# Altium schematic sheet UHF.SchDoc
size A3; SheetNumber: 8; SheetTotal: 11
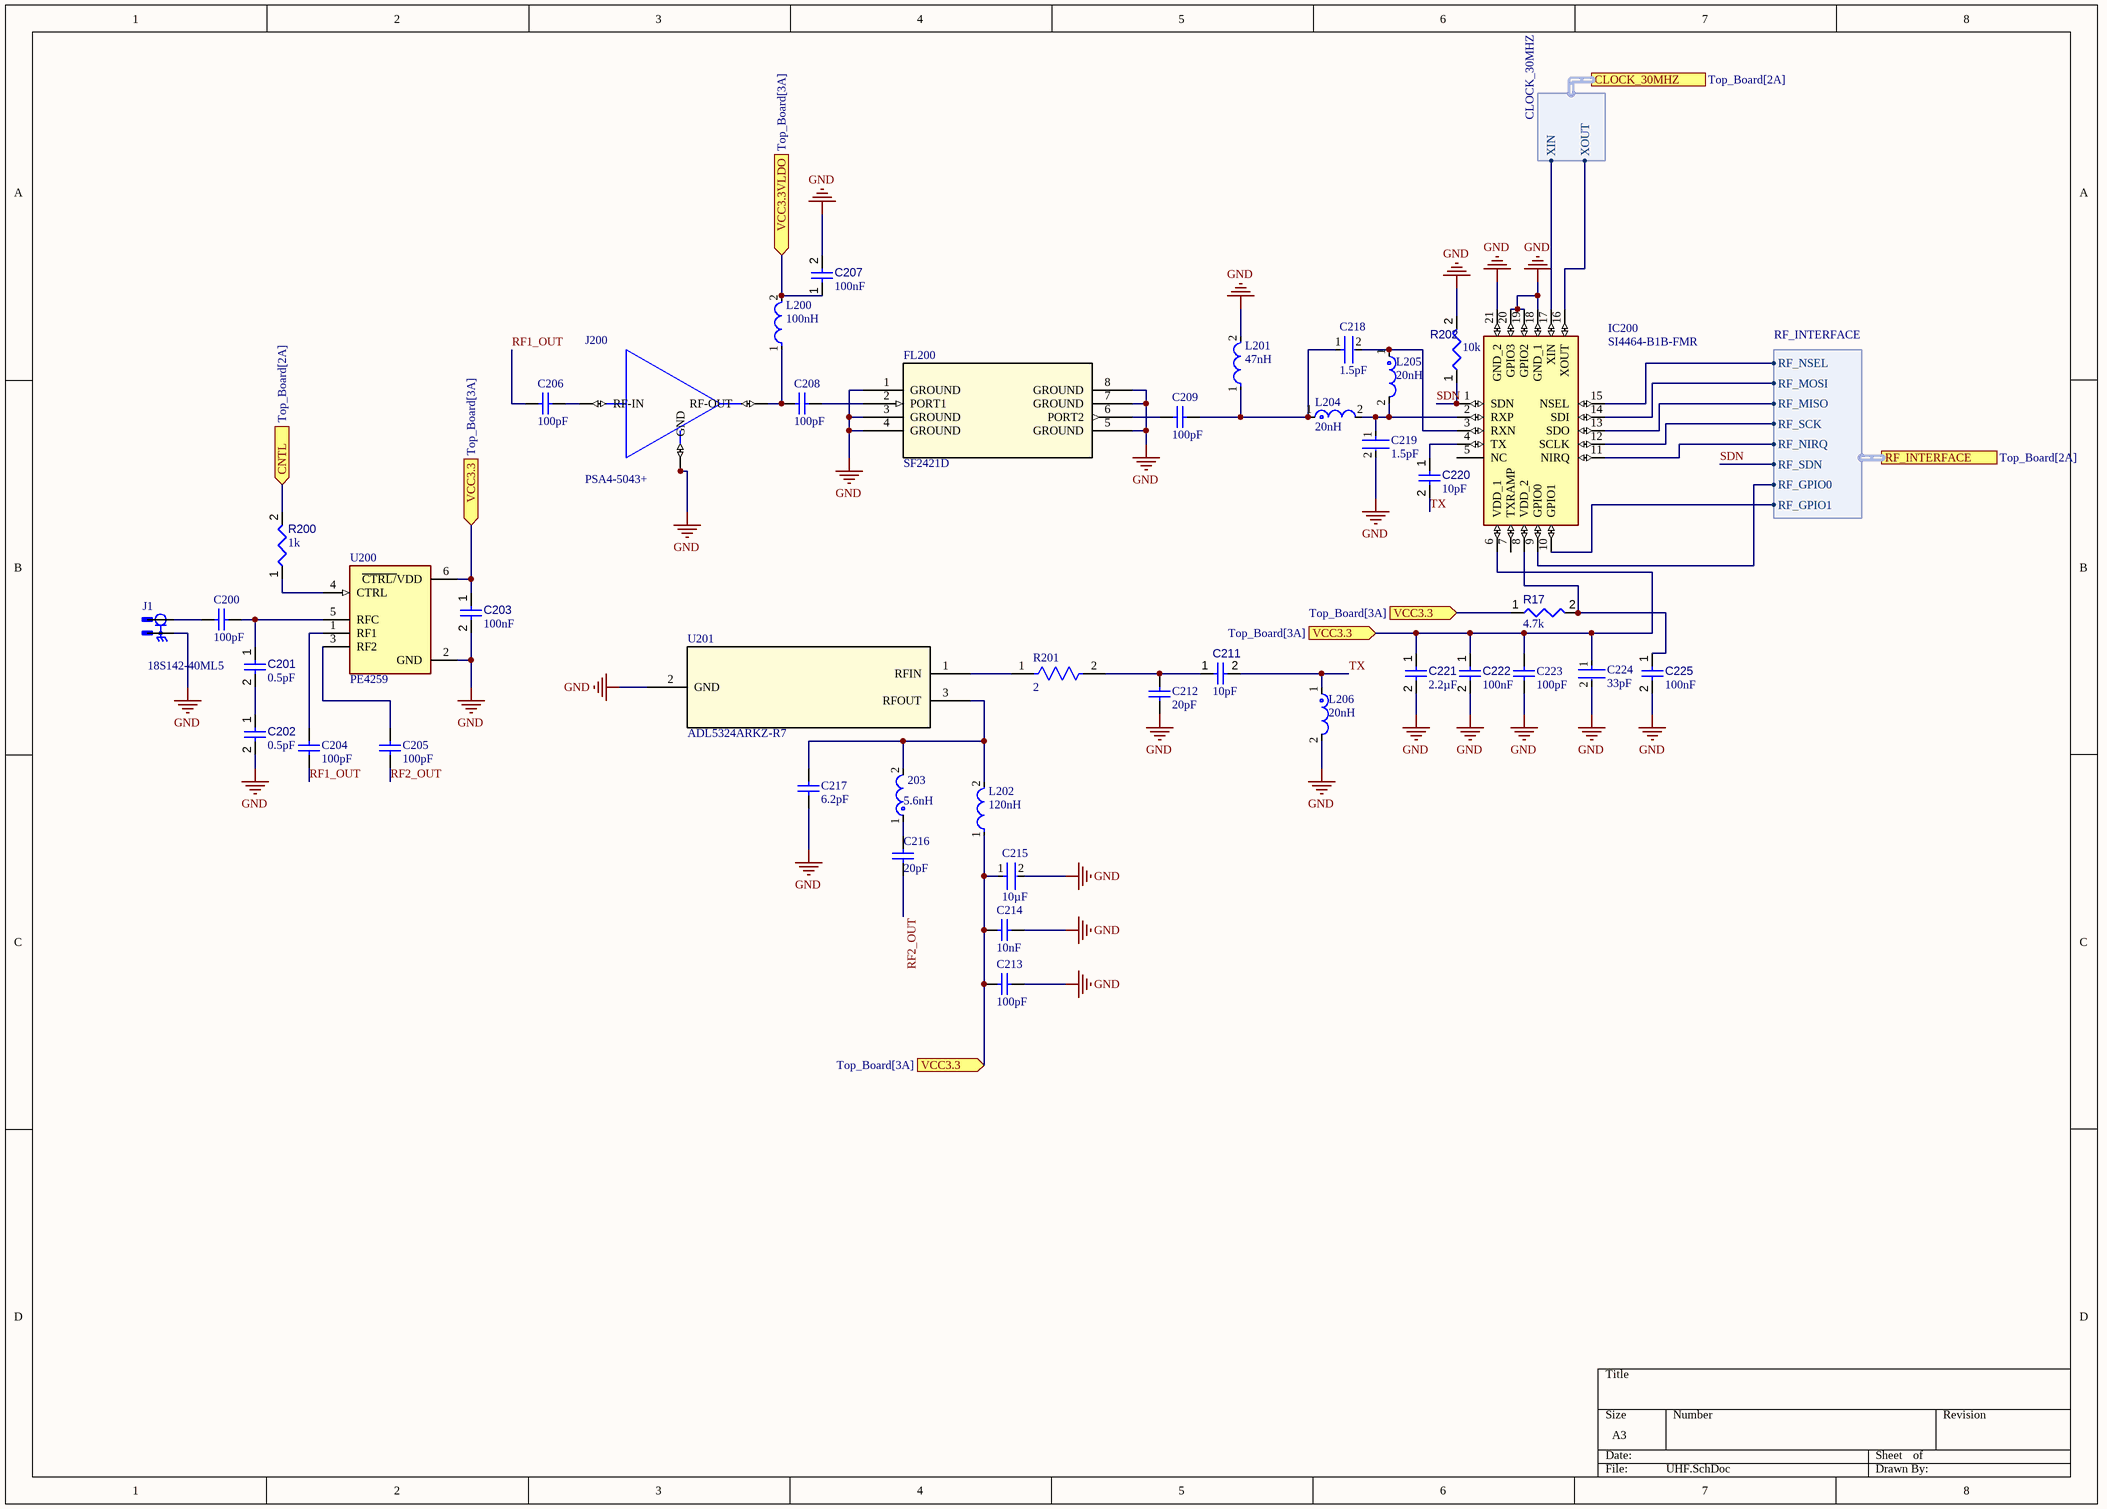
[diagram p0: UHF.SchDoc]

## Parts
203  value 5.6nH  [FP-LQP03TG_02-IPC_C]  (hidden comment: ind 5.6nH 0603)
C200  value 100pF  [CAPC1005X60X26ML10T16]  (hidden comment: cap 100p)
C201  value 0.5pF  [CAPC1005X56X25ML10T15]  (hidden comment: Capacitor 0.5 pF +/- 0.1pF 25 V 0402)
C202  value 0.5pF  [CAPC1005X56X25ML10T15]  (hidden comment: Capacitor 0.5 pF +/- 0.1pF 25 V 0402)
C203  value 100nF  [CAPC0402(1005)60_L]  (hidden comment: Capacitor 100nF +/-20% 50V 0402)
C204  value 100pF  [CAPC1005X60X26ML10T16]  (hidden comment: cap 100p)
C205  value 100pF  [CAPC1005X60X26ML10T16]  (hidden comment: cap 100p)
C206  value 100pF  [CAPC1005X60X26ML10T16]  (hidden comment: cap 100p)
C207  value 100nF  [CAPC2013X95X50LL10T25]  (hidden comment: Capacitor 100 nF +/-10% 50 V 0805)
C208  value 100pF  [CAPC1005X60X26ML10T16]  (hidden comment: cap 100p)
C209  value 100pF  [CAPC1005X60X26ML10T16]  (hidden comment: cap 100p)
C211  value 10pF  [CAPC1608X90X40ML10T20]  (hidden comment: Capacitor 10 pF +/- 5% 50 V 0603)
C212  value 20pF  [CAPC1608X90X35LL15T15]  (hidden comment: cap 20p 0603)
C213  value 100pF  [CAPC1608X92X38LL15T08]  (hidden comment: cap 100pF 0603)
C214  value 10nF  [CAPC1608X92X38LL15T08]  (hidden comment: cap 10nF 0603)
C215  value 10µF  [FP-CC0603-DC-IPC_B]  (hidden comment: cap 10uF 0603)
C216  value 20pF  [CAPC1608X90X35LL15T15]  (hidden comment: cap 20p 0603)
C217  value 6.2pF  [CAPC1608X90X35LL15T15]  (hidden comment: cap 6.2pF 0603)
C218  value 1.5pF  [FP-GJM155-0_05-IPC_A]  (hidden comment: cap 1.5pF)
C219  value 1.5pF  [FP-GJM155-0_05-IPC_A]  (hidden comment: cap 1.5pF)
C220  value 10pF  [CAPC1608X90X40ML10T20]  (hidden comment: Capacitor 10 pF +/- 5% 50 V 0603)
C221  value 2.2µF  [CAPC0402(1005)60_L]  (hidden comment: Capacitor 2,2µF +/-20% 10V 0402)
C222  value 100nF  [CAPC1608X90X40NL10T20]  (hidden comment: Capacitor 100 nF +/-10% 50 V 0603)
C223  value 100pF  [CAPC1608X92X38LL15T08]  (hidden comment: cap 100pF 0603)
C224  value 33pF  [FP-C0603C-CF-IPC_B]  (hidden comment: cap 33pF 0603)
C225  value 100nF  [CAPC1608X90X40NL10T20]  (hidden comment: Capacitor 100 nF +/-10% 50 V 0603)
FL200  SF2421D  [SM3838-8_RFI]
IC200  SI4464-B1B-FMR  [QFN50P400X400X90-21N]
J1  18S142-40ML5  [ROSENBERGER_18S142-40ML5]
J200  PSA4-5043+  [PSA4-5043+]
L200  value 100nH  [FP-0402HPH-MFG]  (hidden comment: ind 100nH)
L201  value 47nH  [FP-MLK1005-MFG]  (hidden comment: ind 47nH)
L202  value 120nH  [FP-AISC-1008-MFG]  (hidden comment: ind 120nH)
L204  value 20nH  [FP-LQG15WH_02-MFG]  (hidden comment: ind 20nH 0402)
L205  value 20nH  [FP-LQG15WH_02-MFG]  (hidden comment: ind 20nH 0402)
L206  value 20nH  [FP-LQG15WH_02-MFG]  (hidden comment: ind 20nH 0402)
R17  value 4.7k  [RESC1608X55X25ML10T15]  (hidden comment: Resistor 4k7 +/-1% 0603 100 mW)
R200  value 1k  [RESC0805(2012)_L]  (hidden comment: Resistor 1K +/-5% 0805 125 mW)
R201  value 2  [FP-RMCF0603-MFG]  (hidden comment: res 2ohms 0603)
R202  value 10k  [RESC2013X50X35ML15T15]  (hidden comment: Resistor 10k +/-1% 0805 125 mW)
U200  PE4259  [SOT65P215X110-6N]
U201  ADL5324ARKZ-R7  [RK_3_ADI]

## Ports
CLOCK_30MHZ (harness CLOCK_30MHZ, see Top_Board[2A]), CNTL (in, see Top_Board[2A]), RF_INTERFACE (harness RF_INTERFACE, see Top_Board[2A]), VCC3.3 (in, see Top_Board[3A]), VCC3.3VLDO (in, see Top_Board[3A])

## Harnesses
CLOCK_30MHZ: XIN, XOUT
RF_INTERFACE: RF_NSEL, RF_MOSI, RF_GPIO1, RF_GPIO0, RF_SDN, RF_NIRQ, RF_SCK, RF_MISO

## Nets
GND: C202.2 C203.2 C207.2 C212.2 C213.2 C214.2 C215.2 C217.2 C219.2 C221.2 C222.2 C223.2 C224.2 C225.2 FL200.1(GROUND) FL200.3(GROUND) FL200.4(GROUND) FL200.5(GROUND) FL200.7(GROUND) FL200.8(GROUND) IC200.18(GND_1) IC200.19(GPIO2) IC200.20(GPIO3) IC200.21(GND_2) J1.G1 J200.2(GND) J200.4(GND) L201.2 L206.2 R202.2 U200.2(GND) U201.2(GND)
CNTL: R200.2 ; port CNTL
RF1_OUT: C204.2 C206.1
RF2_OUT: C205.2 C216.2
SDN: IC200.1(SDN) R202.1 ; port RF_INTERFACE.RF_SDN
TX: C211.2 C220.2 L206.1
VCC3.3: C203.1 C213.1 C214.1 C215.1 C221.1 C222.1 C223.1 C224.1 IC200.6(VDD_1) L202.1 R17.1 U200.6(~{CTRL/}VDD) ; port VCC3.3
VCC3.3VLDO: C207.1 L200.2 ; port VCC3.3VLDO
Net203_1: 203.1 C216.1
Net203_2: 203.2 C217.1 L202.2 U201.3(RFOUT)
NetC200_1: C200.1 J1.1
NetC200_2: C200.2 C201.1 U200.5(RFC)
NetC201_2: C201.2 C202.1
NetC204_1: C204.1 U200.1(RF1)
NetC205_1: C205.1 U200.3(RF2)
NetC206_2: C206.2 J200.3(RF-IN)
NetC208_1: C208.1 J200.1(RF-OUT) L200.1
NetC208_2: C208.2 FL200.2(PORT1)
NetC209_1: C209.1 FL200.6(PORT2)
NetC209_2: C209.2 C218.1 L201.1 L204.1
NetC211_1: C211.1 C212.1 R201.2
NetC218_2: C218.2 IC200.3(RXN) L205.1
NetC219_1: C219.1 IC200.2(RXP) L204.2 L205.2
NetC220_1: C220.1 IC200.4(TX)
NetC225_1: C225.1 IC200.8(VDD_2) R17.2
NetIC200_9: IC200.9(GPIO0) ; port RF_INTERFACE.RF_GPIO0
NetIC200_10: IC200.10(GPIO1) ; port RF_INTERFACE.RF_GPIO1
NetIC200_11: IC200.11(NIRQ) ; port RF_INTERFACE.RF_NIRQ
NetIC200_12: IC200.12(SCLK) ; port RF_INTERFACE.RF_SCK
NetIC200_13: IC200.13(SDO) ; port RF_INTERFACE.RF_MISO
NetIC200_14: IC200.14(SDI) ; port RF_INTERFACE.RF_MOSI
NetIC200_15: IC200.15(NSEL) ; port RF_INTERFACE.RF_NSEL
NetIC200_16: IC200.16(XOUT) ; port CLOCK_30MHZ.XOUT
NetIC200_17: IC200.17(XIN) ; port CLOCK_30MHZ.XIN
NetR200_1: R200.1 U200.4(CTRL)
NetR201_1: R201.1 U201.1(RFIN)

Not connected (* = marked no-connect by the designer): IC200 5(NC) 7(TXRAMP)

## Library data of the parts
203 = CMP-006-00034-1: General Purpose Inductor, 0.0056uH, 5%, 1 Element, Film-Core, Reflow soldering, 0603/0201; Self Resonant Frequency: 4GHz; Current Rating: 350mA; Max Operating Temperature: 125°C; Min Operating Temperature: -55°C; Tolerance: 5%; Max Current Rating: 350mA; Case/Package: 0201
C200 C204-C206 C208 C209 = CMP-001-00096-1: Ceramic Capacitor, Multilayer, Ceramic, 50V, 1% +Tol, 1% -Tol, C0G, 30ppm/Cel TC, 0.0001uF, Surface Mount, 0402; Packaging: Tape and Reel; Height: 600µm; Min Operating Temperature: -55°C; Max Operating Temperature: 150°C; China RoHS: Compliant; Width: 500µm; Case/Package: 0402; Depth: 500µm; REACH SVHC: Unaffected; Lifecycle Status: Production; Voltage Rating (DC): 50V; Mounting Technology: Surface Mount; Tolerance: 1%; Dielectric: C0G; Dielectric Material: Ceramic; Number of Terminals: 2; Length: 1mm; RoHS: Compliant
C201 C202 = CMP-001-00002-6: Chip Capacitor, 0.5 pF, +/- 0.1pF, 25 V, 0402 (1005 Metric); Voltage Rating: 25V; Tolerance: 20%; Capacitor Type: Ceramic; Max Operating Temperature: 125°C; Case/Package: 0402; Pins: 2; RoHS Compliant: True; Min Operating Temperature: -55°C; Mounting Technology: SM
C203 = CMP-001-00067-3: Chip Capacitor, 100nF +/-20%, 50V, 0402, Thickness 0.6 mm; Tolerance: 10%; Min Operating Temperature: -55°C; Pins: 2; Case/Package: 0402; Max Operating Temperature: 85°C; Voltage Rating: 50V; Mounting Technology: SMT
C207 = CMP-001-00018-6: Chip Capacitor, 100 nF, +/- 10%, 50 V, 0805 (2012 Metric); Capacitor Type: Ceramic; Voltage Rating: 50V; Pins: 2; Max Operating Temperature: 125°C; Min Operating Temperature: -55°C; Mounting Technology: SM; Case/Package: 0805; RoHS Compliant: True; Tolerance: 10%
C211 C220 = CMP-001-00014-6: Chip Capacitor, 10 pF, +/- 5%, 50 V, 0603 (1608 Metric); Capacitor Type: Ceramic; Voltage Rating: 50V; RoHS Compliant: True; Case/Package: 0603; Max Operating Temperature: 125°C; Pins: 2; Tolerance: 5%; Mounting Technology: SM; Min Operating Temperature: -55°C
C212 C216 = CMP-001-00097-1: 0603 20 pF 50 V ±10 % Tolerance C0G/NP0 SMT Multilayer Ceramic Capacitor; Tolerance: 10%; Voltage Rating: 50V; Pins: 2; Min Operating Temperature: -55°C; Max Operating Temperature: 125°C; Mounting Technology: Surface Mount; Case/Package: 0603
C213 C223 = CMP-001-00098-1: Ceramic Capacitor, Multilayer, Ceramic, 100V, 10% +Tol, 10% -Tol, C0G, 30ppm/Cel TC, 0.0001uF, Surface Mount, 0603; RoHS: Compliant; China RoHS: Compliant; Case/Package: 0603; Mounting Technology: Surface Mount; Max Operating Temperature: 150°C; Dielectric Material: Ceramic; Number of Terminals: 2; Export Control Classification Number (ECCN) Code: EAR99; Country of Origin: Israel; Harmonized Tariff Schedule (HTS) Code: 8532.24.00.20; Min Operating Temperature: -55°C; Case Code (Metric): 1608; Tolerance: 10%; Termination: SMD/SMT; Lifecycle Status: Production; Voltage Rating (DC): 100V; Depth: 800µm; Length: 1.6mm; Width: 800µm; Dielectric: C0G; Height: 970µm; Case Code (Imperial): 0603; Introduction Date: 1999-11-09; REACH SVHC: Unaffected
C214 = CMP-001-00099-1: Ceramic Capacitor, Multilayer, Ceramic, 50V, 10% +Tol, 10% -Tol, X7R, 15% TC, 0.01uF, Surface Mount, 0603; Lifecycle Status: Production; REACH SVHC: Unaffected; Depth: 800µm; Dielectric: X7R; China RoHS: Non-Compliant; Width: 800µm; Min Operating Temperature: -55°C; RoHS: Compliant; Max Operating Temperature: 150°C; Voltage Rating (DC): 50V; Length: 1.6mm; Height: 970µm; Tolerance: 10%; Case/Package: 0603; Mounting Technology: Surface Mount; Number of Terminals: 2; Dielectric Material: Ceramic
C215 = CMP-001-00100-1: 16V 10uF X5R ±10% 0603 Multilayer Ceramic Capacitors MLCC - SMD/SMT ROHS; Dielectric Material: Ceramic; Number of Terminals: 2; RoHS: Compliant; Export Control Classification Number (ECCN) Code: EAR99; REACH SVHC: Unaffected; Height: 800µm; Introduction Date: 2014-07-08; Mounting Technology: Surface Mount; Tolerance: 10%; Length: 1.6mm; Country of Origin: Mainland China, Taiwan; Halogen Free: Halogen Free; Voltage Rating: 16V; Harmonized Tariff Schedule (HTS) Code: 8532.24.00.20; China RoHS: Compliant; Min Operating Temperature: -55°C; Lifecycle Status: Production; Lead Free: Lead Free; Material: Ceramic; Dielectric: X5R; Max Operating Temperature: 85°C; Voltage Rating (DC): 16V; Case/Package: 0603; Width: 800µm
C217 = CMP-001-00101-1: 50V 6.2pF C0G 0603 Multilayer Ceramic Capacitors MLCC - SMD/SMT ROHS; Export Control Classification Number (ECCN) Code: EAR99; Termination: SMD/SMT; Length: 1.6mm; Number of Terminals: 2; Dielectric Material: Ceramic; Lifecycle Status: Production; Voltage Rating (DC): 50V; Weight: 2.012816mg; Case Code (Imperial): 0603; Dielectric: C0G; Width: 812.8µm; Lead Free: Lead Free; RoHS: Compliant; Thickness: 889µm; Mounting Technology: Surface Mount; Introduction Date: 2013-04-23; Max Operating Temperature: 125°C; China RoHS: Compliant; Radiation Hardening: No; Depth: 810µm; Harmonized Tariff Schedule (HTS) Code: 8532.24.00.20; Voltage Rating: 50V; Case Code (Metric): 1608; Case/Package: 0603; REACH SVHC: Unaffected; Min Operating Temperature: -55°C
C218 C219 = CMP-001-00102-1: Ceramic Capacitor, Multilayer, Ceramic, 50V, 16.67% +Tol, 16.67% -Tol, CH, 60ppm/Cel TC, 0.0000015uF, Surface Mount,...; Manufacturer Lifecycle Status: IN PRODUCTION; Temperature Coefficient: 60ppm/°C; Lifecycle Status: Production; Number of Terminals: 2; RoHS: Compliant; Voltage Rating (DC): 50V; Case/Package: 0402; REACH SVHC: Unaffected; Mounting Technology: Surface Mount; Length: 1mm; Voltage Rating: 50V; Height: 500µm; Thickness: 500µm; Min Operating Temperature: -55°C; Width: 500µm; Material: Ceramic; Dielectric Material: Ceramic; Max Operating Temperature: 125°C
C221 = CMP-001-00056-4: Chip Capacitor, 2,2µF +/-20%, 10V, 0402, Thickness 0.6 mm; Tolerance: 10%; Mounting Technology: SMT; Max Operating Temperature: 85°C; Case/Package: 0402; Pins: 2; Min Operating Temperature: -55°C; Voltage Rating: 10V
C222 C225 = CMP-001-00017-6: Chip Capacitor, 100 nF, +/- 10%, 50 V, 0603 (1608 Metric); Voltage Rating: 50V; Capacitor Type: Ceramic; Tolerance: 10%; Mounting Technology: SM; Max Operating Temperature: 125°C; RoHS Compliant: True; Pins: 2; Case/Package: 0603; Min Operating Temperature: -55°C
C224 = CMP-001-00103-1: Ceramic Capacitor, Multilayer, Ceramic, 50V, 20% +Tol, 20% -Tol, X8R, 15% TC, 3.3e-05uF, Surface Mount, 0603; Temperature Coefficient: 30ppm/°C; Min Operating Temperature: -55°C; Dielectric Material: Ceramic; RoHS: Compliant; Mounting Technology: Surface Mount; Lifecycle Status: Production; Lead Free: Lead Free; Number of Terminals: 2; China RoHS: Compliant; Width: 800µm; Length: 1.6mm; Country of Origin: Mexico; Voltage Rating: 50V; REACH SVHC: Unaffected; Material: Ceramic; Harmonized Tariff Schedule (HTS) Code: 8532.24.00.20; Introduction Date: 2017-10-02; Export Control Classification Number (ECCN) Code: EAR99; Max Operating Temperature: 150°C; Case/Package: 0603; Voltage Rating (DC): 50V; Height: 800µm; Dielectric: X8R
FL200 = CMP-040-000000-1: No Description Available; Manufacturer_Name: RFMi; Source: SF2421D.SchLib; RefDes: RefDes; Copyright: Copyright (C) 2026 Ultra Librarian. All rights reserved.; Type: SAW Filters; Design Item ID: SF2421D; Manufacturer_Part_Number: SF2421D; Component Type: Filters
IC200 = CMP-031-00007-1: IC RF TxRx + MCU General ISM < 1GHz - 119MHz ~ 1.05GHz 20-VFQFN Exposed Pad; MF: Silicon Labs; Component Type: Standard; Pins: 21; Check_prices: https://www.snapeda.com/parts/SI4464-B1B-FMR/Silicon+Labs/view-part/?ref=eda; Case/Package: QFN-20 Silicon Labs; SnapEDA_Link: https://www.snapeda.com/parts/SI4464-B1B-FMR/Silicon+Labs/view-part/?ref=snap; Design Item ID: SI4464-B1B-FMR; Source: SI4464-B1B-FMR.SchLib; MP: SI4464-B1B-FMR; Value: *; Component Type: Integrated Circuits
J1 = CMP-002-00075-1: SMP, Mini Connector Plug, Male Pin 50 Ohms Surface Mount Solder; MF: Rosenberger; Case/Package: None; Source: 18S142-40ML5.SchLib; Design Item ID: 18S142-40ML5; MP: 18S142-40ML5; Check_prices: https://www.snapeda.com/parts/18S142-40ML5/Rosenberger/view-part/?ref=eda; Pins: 2; Component Type: Standard; SnapEDA_Link: https://www.snapeda.com/parts/18S142-40ML5/Rosenberger/view-part/?ref=snap; Value: *; Component Type: Connectors
J200 = CMP-014-00003-1: RF Amplifier IC Cellular, GSM, GPS, ISM, LTE, WCDMA, WiMAX, WLAN 50MHz ~ 4GHz MMM1362; MF: Mini-Circuits; Component Type: Standard; Design Item ID: PSA4-5043+; Pins: 4; Case/Package: None; SnapEDA_Link: https://www.snapeda.com/parts/PSA4-5043+/Mini-Circuits/view-part/?ref=snap; Source: PSA4-5043+.SchLib; Check_prices: https://www.snapeda.com/parts/PSA4-5043+/Mini-Circuits/view-part/?ref=eda; Value: *; MP: PSA4-5043+; Component Type: Amplifiers
L200 = CMP-006-00024-1: General Purpose Inductor, 0.1uH, 5%, 1 Element, Ceramic-Core, SMD, 0402; ESR: 1.2Ω; Test Frequency: 250MHz; Current Rating: 310mA; Number of Circuits: 1; Self Resonant Frequency: 1.58GHz; Shielding: Unshielded; Lead Free: Contains Lead; Export Control Classification Number (ECCN) Code: EAR99; Height: 660µm; Inductance Tolerance: 5%; Country of Origin: Mainland China, Vietnam; LTD Date: 2021-03-01; LTB Date: 2021-03-01; Width: 660µm; Termination: SMD/SMT; DC Resistance (DCR): 1.2Ω; Lifecycle Status: Obsolete; Case Code (Imperial): 0402; Composition: Wirewound; Tolerance: 5%; Case/Package: 0402; Max Current Rating: 310mA; Core Material: Ceramic; Mounting Technology: Surface Mount; Harmonized Tariff Schedule (HTS) Code: 8504.50.80.00; RMS Current (Irms): 310mA; Case Code (Metric): 1005; Packaging: Cut Tape; Max Operating Temperature: 125°C; Min Operating Temperature: -40°C; Number of Terminals: 2; REACH SVHC: Unaffected; China RoHS: Non-Compliant; RoHS: Compliant; Introduction Date: 2009-03-31; Ambient Temperature Range High: 125°C; Length: 1.12mm; Max DC Current: 310mA
L201 = CMP-006-00029-1: Ind RF Chip Unshielded Multi-Layer 47nH 5% 100MHz 6Q-Factor 200mA 0402 Punched Paper T/R; Manufacturer Lifecycle Status: OBSOLETE; ESR: 1.2Ω; Core Material: Ceramic, Ferrite; Number of Circuits: 1; Self Resonant Frequency: 1.8GHz; Q Factor: 6; Number of Terminals: 2; China RoHS: Compliant; REACH SVHC: Unaffected; Schedule B: 8504500000, 8504500000; Max DC Current: 200mA; RMS Current (Irms): 200mA; Radiation Hardening: No; Width: 500µm; DC Resistance (DCR): 1.2Ω; Height - Seated (Max): 609.6µm; Lifecycle Status: Obsolete; Height: 500µm; Harmonized Tariff Schedule (HTS) Code: 8504.50.80.00; Depth: 600µm; Shielding: Unshielded; Max Operating Temperature: 125°C; Test Frequency: 100MHz; Case Code (Metric): 1005; Export Control Classification Number (ECCN) Code: EAR99; Tolerance: 5%; Min Operating Temperature: -55°C; RoHS: Compliant; Packaging: Cut Tape (CT); Min Width: 400µm; Case Code (Imperial): 0402; LTD Date: 2026-06-30; Current Rating: 200mA; Max Length: 1.1mm; Length: 1mm; Mounting Technology: Surface Mount; Min Length: 900µm; Max Width: 600µm; Max Current Rating: 200mA; Case/Package: 0402; LTB Date: 2026-03-31; Introduction Date: 2009-03-27
L202 = CMP-006-00030-1: Ind Chip Wirewound 120nH 5% 25MHz 60Q-Factor Ceramic 650mA 1008 T/R; ESR: 630mΩ; Q Factor: 60; Number of Circuits: 1; Self Resonant Frequency: 950MHz; Shielding: Unshielded; China RoHS: Compliant; Number of Terminals: 2; Lifecycle Status: Production; Termination: SMD/SMT; Max Operating Temperature: 125°C; Depth: 2.79mm; Tolerance: 5%; Test Frequency: 25MHz; Width: 2.79mm; DC Resistance (DCR): 630mΩ; Min Operating Temperature: -40°C; Length: 2.92mm; Height - Seated (Max): 2.286mm; Height: 2.29mm; Case/Package: 1111; Radiation Hardening: No; Mounting Technology: Surface Mount; Case Code (Imperial): 1008; Max DC Current: 650mA; Case Code (Metric): 2520; REACH SVHC: Unaffected; RMS Current (Irms): 650mA; Composition: Wirewound; Core Material: Ceramic; RoHS: Compliant; Current Rating: 650mA; Max Current Rating: 650mA
L204-L206 = CMP-006-00022-1: General Purpose Inductor, 0.02uH, 3%, 1 Element, Reflow soldering, 1005/0402; Manufacturer Lifecycle Status: IN PRODUCTION; Shielding: Unshielded; Test Frequency: 250MHz; Max Current Rating: 260mA; ESR: 1.1Ω; Self Resonant Frequency: 2.1GHz; Q Factor: 20; Core Material: Air; Number of Circuits: 1; Width: 600µm; Max Operating Temperature: 125°C; Export Control Classification Number (ECCN) Code: EAR99; REACH SVHC: Unaffected; Tolerance: 3%; Number of Terminals: 2; Lifecycle Status: Production; Length: 1mm; Harmonized Tariff Schedule (HTS) Code: 8504.50.80.00; Case/Package: 0402; DC Resistance (DCR): 1.1Ω; RMS Current (Irms): 260mA; Height: 500µm; Country of Origin: Japan; Ratings: AEC-Q200; Current Rating: 260mA; Min Operating Temperature: -55°C; RoHS: Compliant; Introduction Date: 2018-02-22
R17 = CMP-009-00031-5: Chip Resistor, 4.7 KOhm, +/- 1%, 0.1 W, -55 to 155 degC, 0603 (1608 Metric); Power: 100mW; Tolerance: 1%; Mounting Technology: SM; Case/Package: 0603; RoHS Compliant: True; Pins: 2; Min Operating Temperature: -55°C; Max Operating Temperature: 155°C
R200 = CMP-009-00118-3: Chip Resistor, 1 kOhms, +/-5%, 125 mW, -55 to 155 degC, 0805; Tolerance: 5%; Power: 125mW; Case/Package: 0805; Pins: 2; Min Operating Temperature: -55°C; Max Operating Temperature: 155°C
R201 = CMP-009-00191-1: Res Thick Film 0603 2 Ohm 5% 0.1W(1/10W) ±200ppm/C Pad SMD Automotive T/R; Working Voltage: 75V; Power Rating: 100mW; Temperature Coefficient: 200ppm/°C; Height: 450µm; RoHS: Compliant; Number of Terminals: 2; Length: 1.55mm; Max Power Dissipation: 100mW; Ratings: AEC-Q200; Min Operating Temperature: -55°C; Width: 800µm; REACH SVHC: Unaffected; Tolerance: 5%; Composition: Thick Film; Number of Terminations: 2; Features: Automotive AEC-Q200; Max Operating Temperature: 155°C; China RoHS: Non-Compliant; Lifecycle Status: Production; Packaging: Digi-Reel®; Case Code (Metric): 1608; Case Code (Imperial): 0603; Voltage Rating: 75V; Mounting Technology: Surface Mount; Lead Free: Lead Free; Contact Plating: Tin; Schedule B: 8533210045, 8533210045; Case/Package: 0603; Radiation Hardening: No
R202 = CMP-009-00018-5: Chip Resistor, 10 KOhm, +/- 1%, 125 mW, -55 to 155 degC, 0805 (2012 Metric); Power: 125mW; Voltage Rating: 150V; Tolerance: 1%; Pins: 2; Min Operating Temperature: -55°C; Case/Package: 0805; Max Operating Temperature: 155°C; RoHS Compliant: True; Mounting Technology: SM
U200 = CMP-031-00008-1: RF Switch IC General Purpose SPDT 3 GHz 50Ohm SC-70-6; MF: pSemi; Pins: 6; Value: *; Check_prices: https://www.snapeda.com/parts/PE4259/pSemi/view-part/?ref=eda; Case/Package: SOT-363 Peregrine Semiconductor; SnapEDA_Link: https://www.snapeda.com/parts/PE4259/pSemi/view-part/?ref=snap; Source: PE4259.SchLib; MP: PE4259; Design Item ID: PE4259; Component Type: Standard
U201 = CMP-014-00004-1: 400 MHz TO 4000 MHz Â½ Watt RF Driver Amplifier; Manufacturer_Name: Analog Devices Inc; Datasheet: https://www.analog.com/media/en/technical-documentation/data-sheets/ADL5324.pdf; Copyright: Copyright (C) 2026 Ultra Librarian. All rights reserved.; RefDes: RefDes; Manufacturer_Part_Number: ADL5324ARKZ-R7; Source: ADL5324ARKZ-R7.SchLib; Design Item ID: ADL5324ARKZ-R7; Type: Type